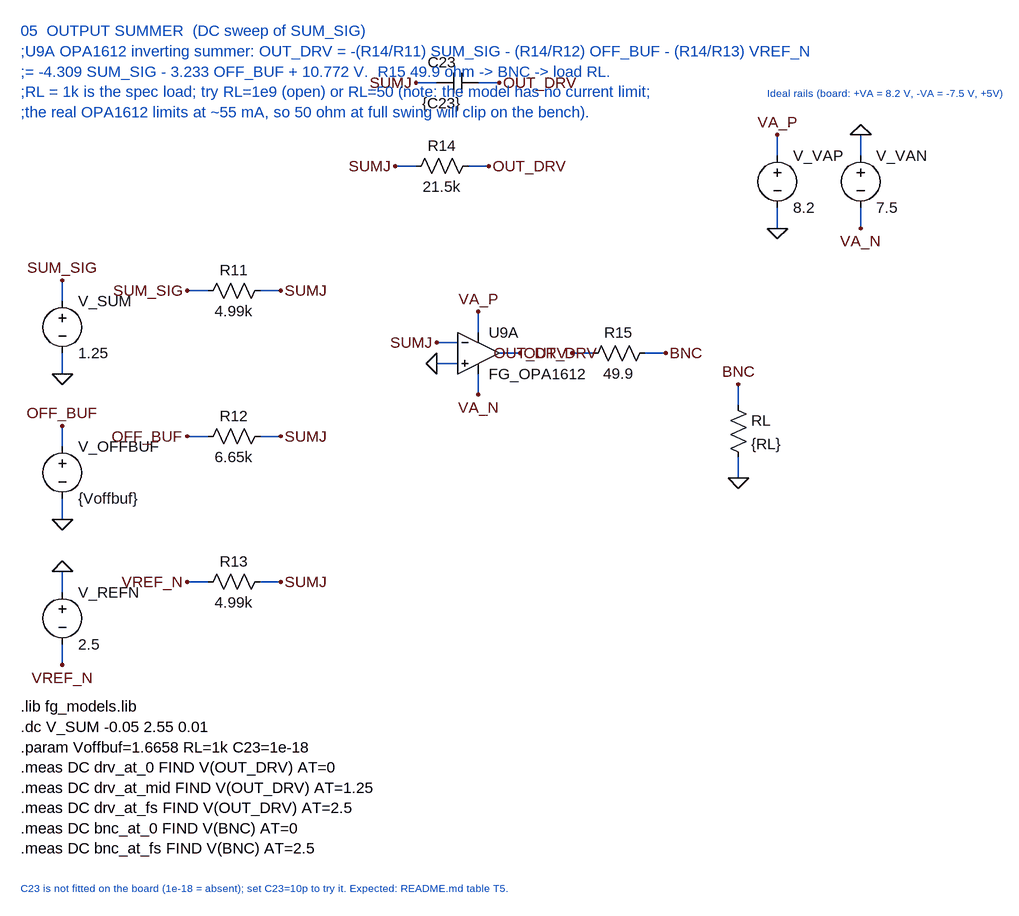
[diagram p0: schematic 05_summer_dc.asc]
05_summer_dc.asc, the LTspice schematic file:
Version 4
SHEET 1 2400 1600
WIRE 1100 -240 1100 -208
WIRE 1100 -96 1100 -128
WIRE 1228 -240 1228 -208
WIRE 1228 -96 1228 -128
WIRE 0 -16 0 16
WIRE 0 128 0 96
WIRE 0 208 0 240
WIRE 0 352 0 320
WIRE 0 432 0 464
WIRE 0 576 0 544
WIRE 336 0 304 0
WIRE 192 0 224 0
WIRE 336 224 304 224
WIRE 192 224 224 224
WIRE 336 448 304 448
WIRE 192 448 224 448
WIRE 656 -192 624 -192
WIRE 512 -192 544 -192
WIRE 672 -320 640 -320
WIRE 544 -320 576 -320
WIRE 576 112 608 112
WIRE 576 80 608 80
WIRE 640 32 640 64
WIRE 640 160 640 128
WIRE 704 96 672 96
WIRE 928 96 896 96
WIRE 784 96 816 96
WIRE 1040 144 1040 176
WIRE 1040 288 1040 256
FLAG 1100 -240 VA_P
FLAG 1100 -96 0
FLAG 1228 -240 0
FLAG 1228 -96 VA_N
FLAG 0 -16 SUM_SIG
FLAG 0 128 0
FLAG 0 208 OFF_BUF
FLAG 0 352 0
FLAG 0 432 0
FLAG 0 576 VREF_N
FLAG 336 0 SUMJ
FLAG 192 0 SUM_SIG
FLAG 336 224 SUMJ
FLAG 192 224 OFF_BUF
FLAG 336 448 SUMJ
FLAG 192 448 VREF_N
FLAG 656 -192 OUT_DRV
FLAG 512 -192 SUMJ
FLAG 672 -320 OUT_DRV
FLAG 544 -320 SUMJ
FLAG 576 112 0
FLAG 576 80 SUMJ
FLAG 640 32 VA_P
FLAG 640 160 VA_N
FLAG 704 96 OUT_DRV
FLAG 928 96 BNC
FLAG 784 96 OUT_DRV
FLAG 1040 144 BNC
FLAG 1040 288 0
TEXT -64 -400 Left 2 ;05  OUTPUT SUMMER  (DC sweep of SUM_SIG)\n;U9A OPA1612 inverting summer: OUT_DRV = -(R14/R11) SUM_SIG - (R14/R12) OFF_BUF - (R14/R13) VREF_N\n;= -4.309 SUM_SIG - 3.233 OFF_BUF + 10.772 V.  R15 49.9 ohm -> BNC -> load RL.\n;RL = 1k is the spec load; try RL=1e9 (open) or RL=50 (note: the model has no current limit;\n;the real OPA1612 limits at ~55 mA, so 50 ohm at full swing will clip on the bench).
SYMBOL voltage 1100 -224 R0
SYMATTR InstName V_VAP
SYMATTR Value 8.2
SYMBOL voltage 1228 -224 R0
SYMATTR InstName V_VAN
SYMATTR Value 7.5
TEXT 1084 -304 Left 1 ;Ideal rails (board: +VA = 8.2 V, -VA = -7.5 V, +5V)
SYMBOL voltage 0 0 R0
SYMATTR InstName V_SUM
SYMATTR Value 1.25
SYMBOL voltage 0 224 R0
SYMATTR InstName V_OFFBUF
SYMATTR Value {Voffbuf}
SYMBOL voltage 0 448 R0
SYMATTR InstName V_REFN
SYMATTR Value 2.5
SYMBOL res 320 -16 R90
WINDOW 0 0 56 VBottom 2
WINDOW 3 32 56 VTop 2
SYMATTR InstName R11
SYMATTR Value 4.99k
SYMBOL res 320 208 R90
WINDOW 0 0 56 VBottom 2
WINDOW 3 32 56 VTop 2
SYMATTR InstName R12
SYMATTR Value 6.65k
SYMBOL res 320 432 R90
WINDOW 0 0 56 VBottom 2
WINDOW 3 32 56 VTop 2
SYMATTR InstName R13
SYMATTR Value 4.99k
SYMBOL res 640 -208 R90
WINDOW 0 0 56 VBottom 2
WINDOW 3 32 56 VTop 2
SYMATTR InstName R14
SYMATTR Value 21.5k
SYMBOL cap 640 -336 R90
WINDOW 0 0 56 VBottom 2
WINDOW 3 32 56 VTop 2
SYMATTR InstName C23
SYMATTR Value {C23}
SYMBOL OpAmps\\opamp2 640 32 R0
SYMATTR InstName U9A
SYMATTR Value FG_OPA1612
SYMBOL res 912 80 R90
WINDOW 0 0 56 VBottom 2
WINDOW 3 32 56 VTop 2
SYMATTR InstName R15
SYMATTR Value 49.9
SYMBOL res 1024 160 R0
SYMATTR InstName RL
SYMATTR Value {RL}
TEXT -64 640 Left 2 !.lib fg_models.lib\n.dc V_SUM -0.05 2.55 0.01\n.param Voffbuf=1.6658 RL=1k C23=1e-18\n.meas DC drv_at_0 FIND V(OUT_DRV) AT=0\n.meas DC drv_at_mid FIND V(OUT_DRV) AT=1.25\n.meas DC drv_at_fs FIND V(OUT_DRV) AT=2.5\n.meas DC bnc_at_0 FIND V(BNC) AT=0\n.meas DC bnc_at_fs FIND V(BNC) AT=2.5
TEXT -64 920 Left 1 ;C23 is not fitted on the board (1e-18 = absent); set C23=10p to try it. Expected: README.md table T5.

The netlist it stands for:
* 05_summer_dc.asc
V_VAP VA_P 0 8.2
V_VAN 0 VA_N 7.5
V_SUM SUM_SIG 0 1.25
V_OFFBUF OFF_BUF 0 {Voffbuf}
V_REFN 0 VREF_N 2.5
R11 SUMJ SUM_SIG 4.99k
R12 SUMJ OFF_BUF 6.65k
R13 SUMJ VREF_N 4.99k
R14 OUT_DRV SUMJ 21.5k
C23 OUT_DRV SUMJ {C23}
XU9A 0 SUMJ VA_P VA_N OUT_DRV FG_OPA1612  ; pins In+ In- V+ V- OUT
R15 BNC OUT_DRV 49.9
RL BNC 0 {RL}
* 05  OUTPUT SUMMER  (DC sweep of SUM_SIG)
* ;U9A OPA1612 inverting summer: OUT_DRV = -(R14/R11) SUM_SIG - (R14/R12) OFF_BUF - (R14/R13) VREF_N
* ;= -4.309 SUM_SIG - 3.233 OFF_BUF + 10.772 V.  R15 49.9 ohm -> BNC -> load RL.
* ;RL = 1k is the spec load; try RL=1e9 (open) or RL=50 (note: the model has no current limit;
* ;the real OPA1612 limits at ~55 mA, so 50 ohm at full swing will clip on the bench).
* Ideal rails (board: +VA = 8.2 V, -VA = -7.5 V, +5V)
.lib fg_models.lib
.dc V_SUM -0.05 2.55 0.01
.param Voffbuf=1.6658 RL=1k C23=1e-18
.meas DC drv_at_0 FIND V(OUT_DRV) AT=0
.meas DC drv_at_mid FIND V(OUT_DRV) AT=1.25
.meas DC drv_at_fs FIND V(OUT_DRV) AT=2.5
.meas DC bnc_at_0 FIND V(BNC) AT=0
.meas DC bnc_at_fs FIND V(BNC) AT=2.5
* C23 is not fitted on the board (1e-18 = absent); set C23=10p to try it. Expected: README.md table T5.
.backanno
.end